# EasyEDA Pro project MACRO12-RevC.epro

# Schematic MACRO12

## Sheets
1 MACRO12_1
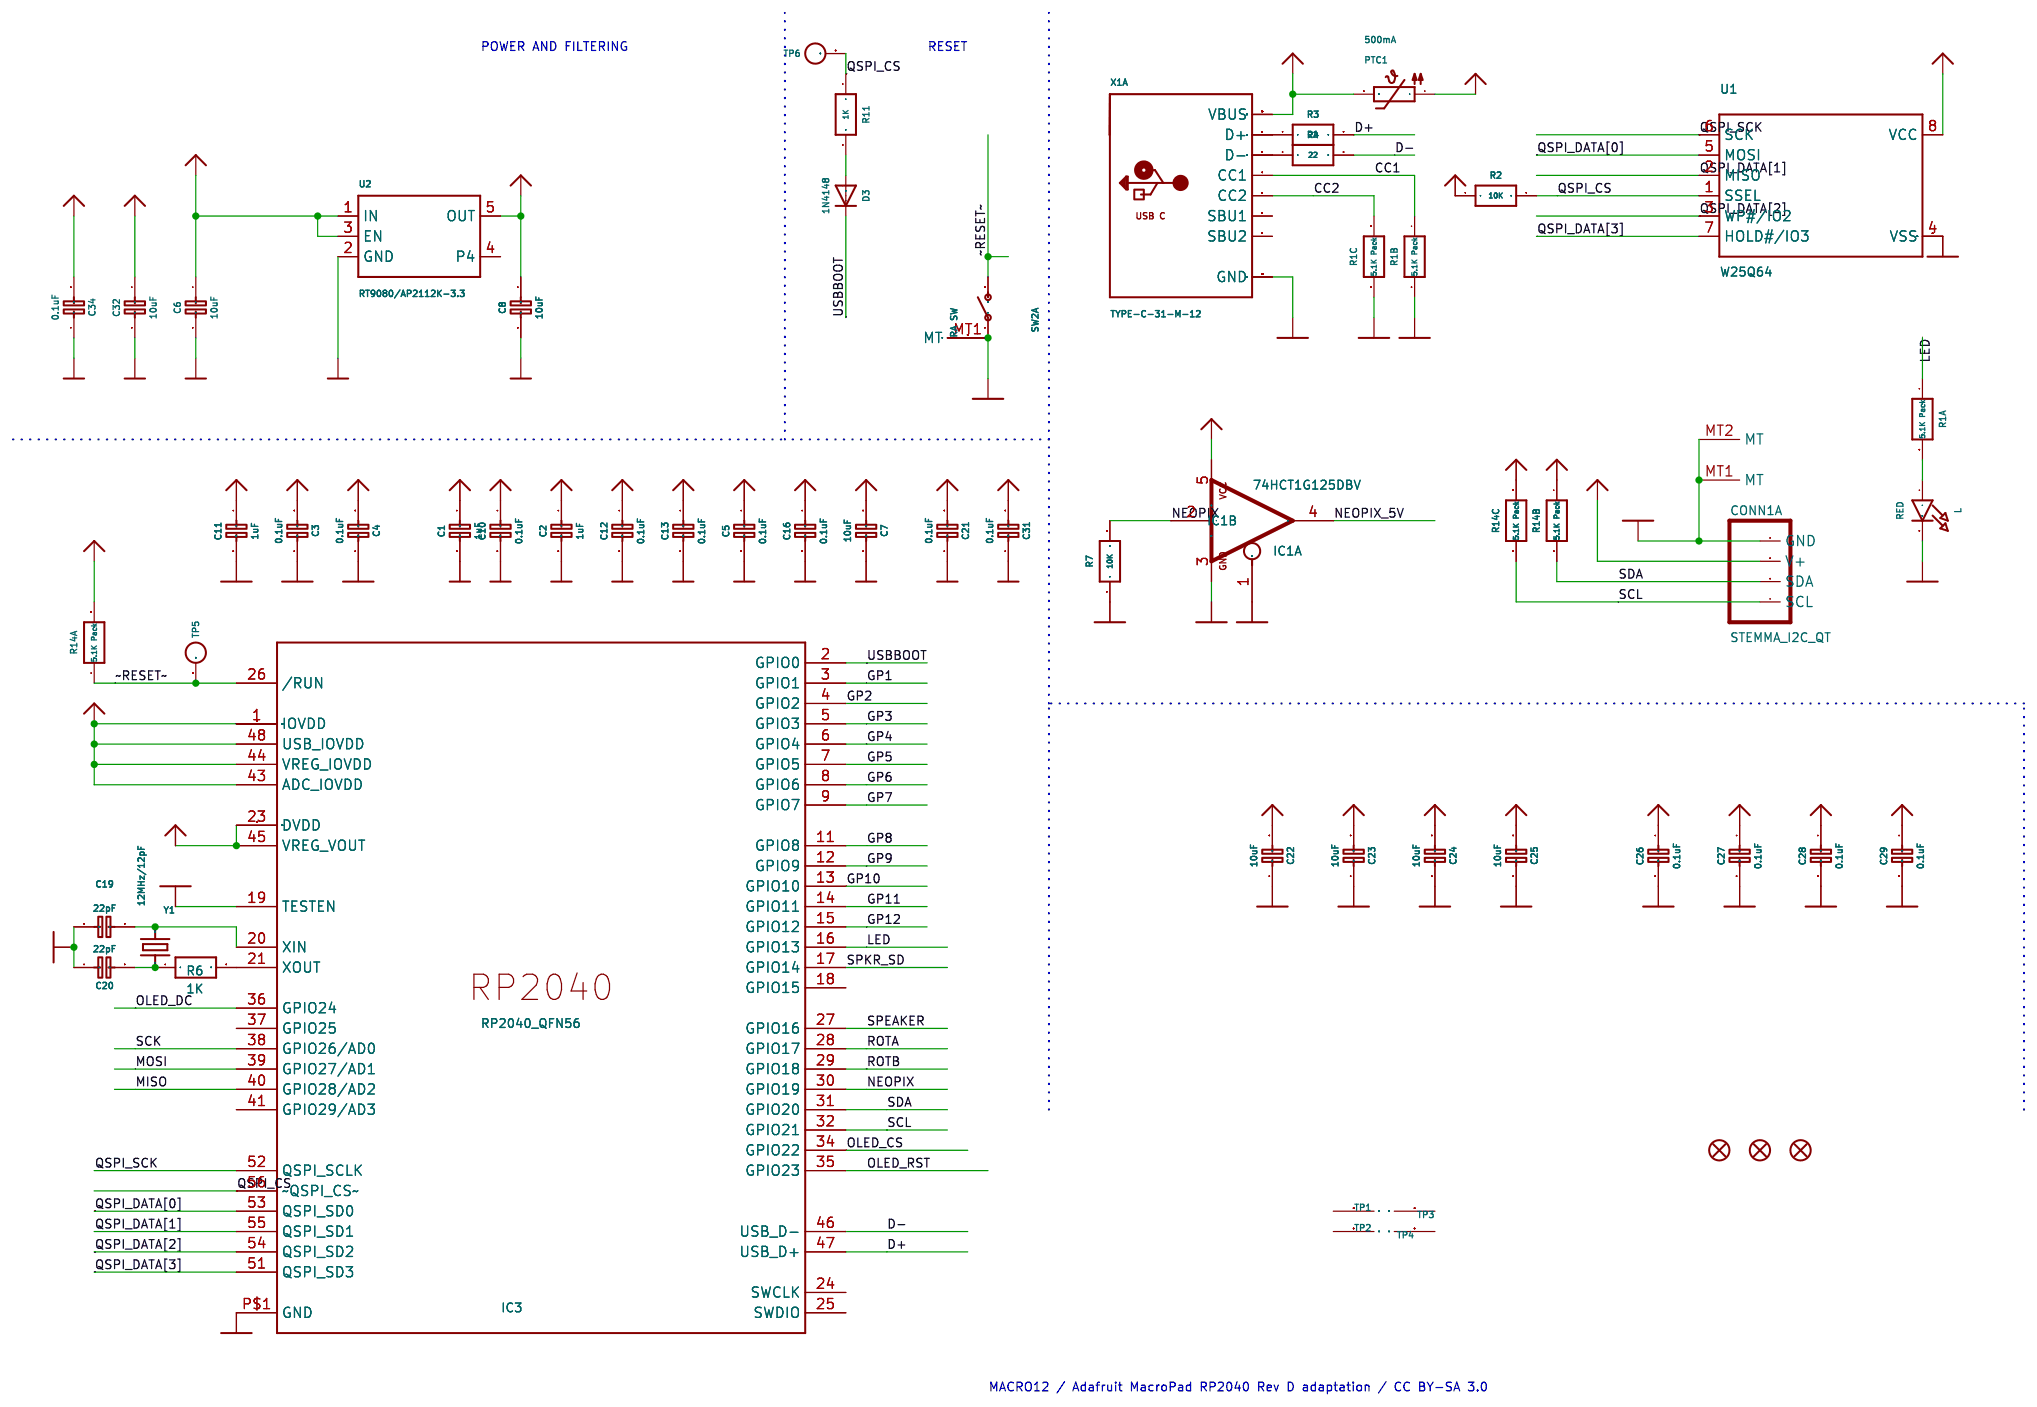
[diagram p0: MACRO12_1]
2 MACRO12_2
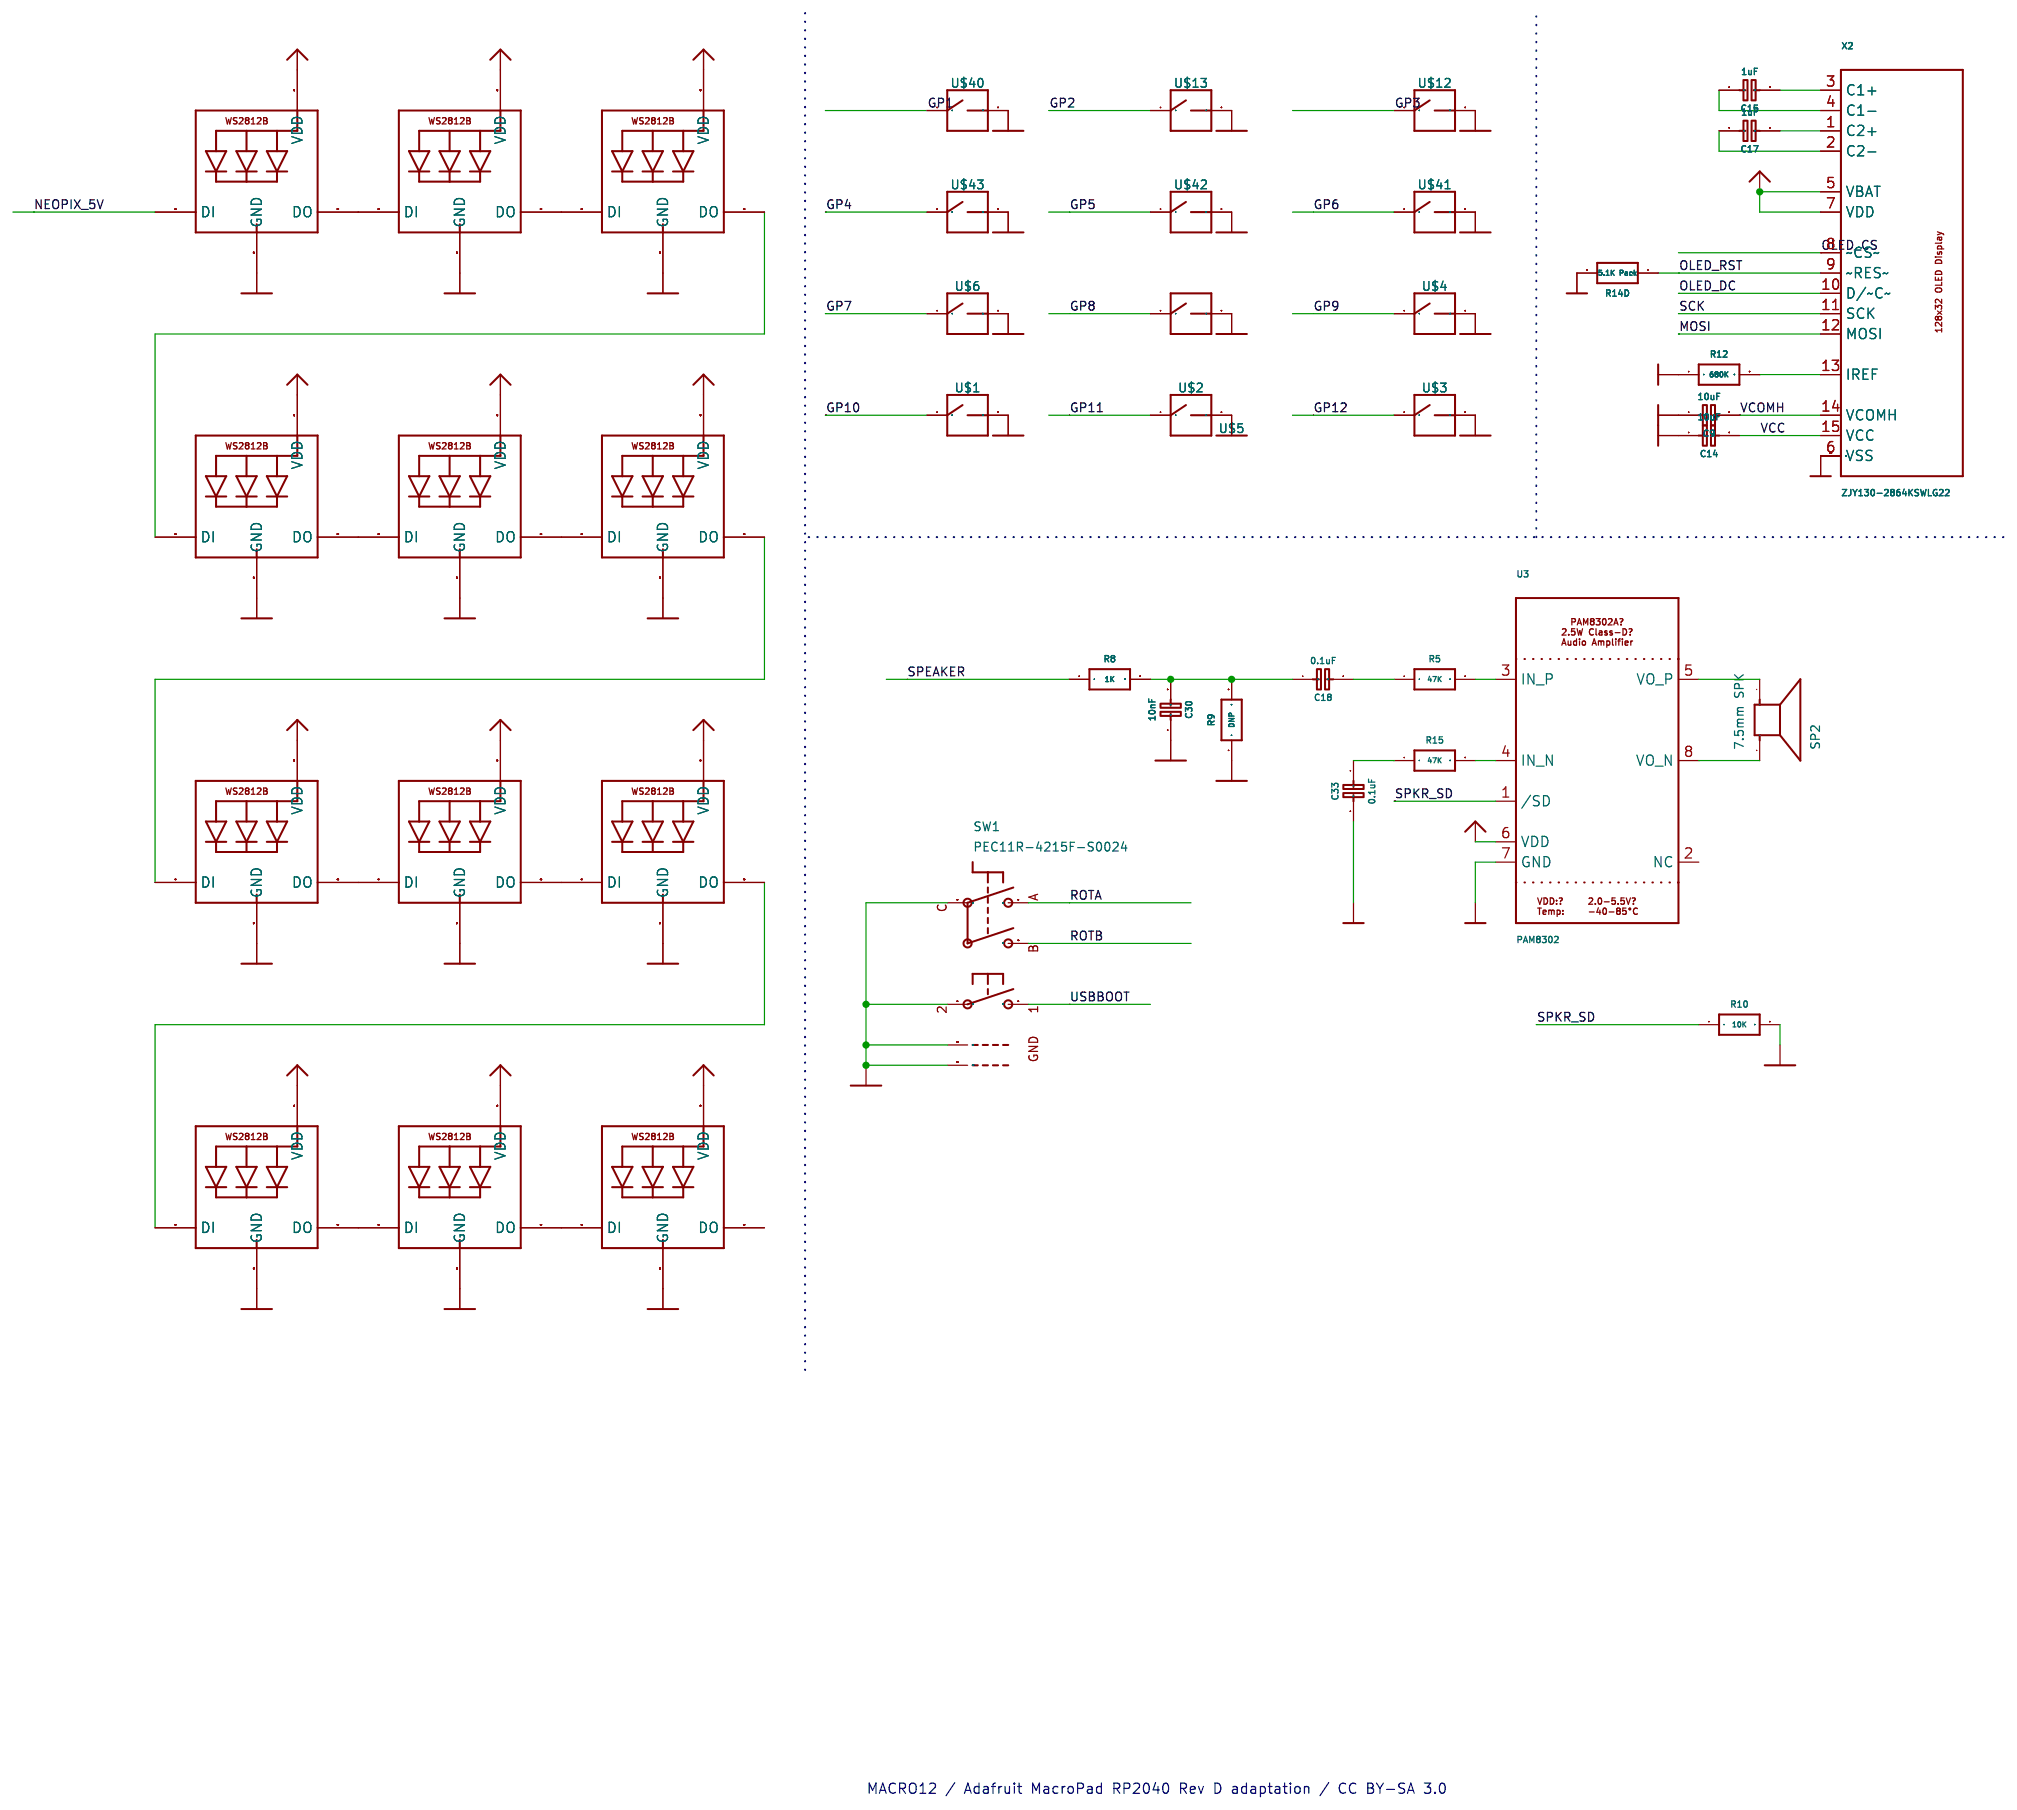
[diagram p1: MACRO12_2]

## Parts
sheet MACRO12_1
C1  1uF  [0603-NO]
C2  1uF  [0603-NO]
C3  0.1uF  [0603-NO]
C4  0.1uF  [0603-NO]
C5  0.1uF  [0603-NO]
C6  10uF  [0805-NO]
C7  10uF  [0805-NO]
C8  10uF  [0805-NO]
C10  0.1uF  [0603-NO]
C11  1uF  [0603-NO]
C12  0.1uF  [0603-NO]
C13  0.1uF  [0603-NO]
C16  0.1uF  [0603-NO]
C19  22pF  [0603-NO]
C20  22pF  [0603-NO]
C21  0.1uF  [0603-NO]
C22  10uF  [0805-NO]
C23  10uF  [0805-NO]
C24  10uF  [0805-NO]
C25  10uF  [0805-NO]
C26  0.1uF  [0603-NO]
C27  0.1uF  [0603-NO]
C28  0.1uF  [0603-NO]
C29  0.1uF  [0603-NO]
C31  0.1uF  [0603-NO]
C32  10uF  [0805-NO]
C34  0.1uF  [0603-NO]
CONN1  STEMMA_I2C_QT  [JST_SH4]  (sections G$1,G$2,G$3)
D3  1N4148  [SOD-323]
IC1  74HCT1G125DBV  [SOT23-5]  (sections A,P)
IC3  RP2040_QFN56  [QFN56_7MM_REDUCEDEPAD]
L  RED  [CHIPLED_0603_NOOUTLINE]
PTC1  500mA  [0805-NO]
R1  5.1K Pack  [RESPACK_4X0603]  (sections G$1,G$2,G$3)
R2  10K  [0603-NO]
R3  22  [0603-NO]
R4  22  [0603-NO]
R6  1K  [0603-NO]
R7  10K  [0603-NO]
R11  1K  [0603-NO]
R14  5.1K Pack  [RESPACK_4X0603]  (sections G$1,G$2,G$3,G$4)
SW2  RA SW  [SPST_TACTILE_RA]  (sections G$1,G$2)
TP1  SEWTAP_SMTNUTM3  [SMT_NUT_3MM]
TP2  SEWTAP_SMTNUTM3  [SMT_NUT_3MM]
TP3  SEWTAP_SMTNUTM3  [SMT_NUT_3MM]
TP4  SEWTAP_SMTNUTM3  [SMT_NUT_3MM]
TP5  TESTPOINTROUND1.5MMNO  [TESTPOINT_ROUND_1.5MM_NO]
TP6  TESTPOINTROUND1.5MMNO  [TESTPOINT_ROUND_1.5MM_NO]
U1  W25Q64  [USON8_4X4]
U2  RT9080/AP2112K-3.3  [SOT23-5_REGULATOR_MACRO12]
U$34  FIDUCIAL_1MM  [FIDUCIAL_1MM]
U$35  FIDUCIAL_1MM  [FIDUCIAL_1MM]
U$80  FIDUCIAL_1MM  [FIDUCIAL_1MM]
X1  TYPE-C-31-M-12  [HRO_TYPE_C_31_M_12]  (section G$1)
Y1  12MHz/12pF  [CRYSTAL_2.5X2]
sheet MACRO12_2
C9  10uF  [0805-NO]
C14  10uF  [0805-NO]
C15  1uF  [0603-NO]
C17  1uF  [0603-NO]
C18  0.1uF  [0603-NO]
C30  10nF  [0603-NO]
C33  0.1uF  [0603-NO]
LED1  WS2812B_SK6812E  [NEO3535_REVERSE]
LED2  WS2812B_SK6812E  [NEO3535_REVERSE]
LED3  WS2812B_SK6812E  [NEO3535_REVERSE]
LED4  WS2812B_SK6812E  [NEO3535_REVERSE]
LED5  WS2812B_SK6812E  [NEO3535_REVERSE]
LED6  WS2812B_SK6812E  [NEO3535_REVERSE]
LED7  WS2812B_SK6812E  [NEO3535_REVERSE]
LED8  WS2812B_SK6812E  [NEO3535_REVERSE]
LED9  WS2812B_SK6812E  [NEO3535_REVERSE]
LED10  WS2812B_SK6812E  [NEO3535_REVERSE]
LED11  WS2812B_SK6812E  [NEO3535_REVERSE]
LED12  WS2812B_SK6812E  [NEO3535_REVERSE]
R5  47K  [0603-NO]
R8  1K  [0603-NO]
R9  DNP  [0603-NO]
R10  10K  [0603-NO]
R12  680K  [0603-NO]
R15  47K  [0603-NO]
SP2  7.5mm SPK  [BUZZER_SMT_7.5MM]
SW1  PEC11R-4215F-S0024  [PEC11R_4215F_S0024_13P2]
U3  PAM8302  [MSOP8_0.65MM]
U$1  SOCKET  [KAILH_SOCKET]
U$2  SOCKET  [KAILH_SOCKET]
U$3  SOCKET  [KAILH_SOCKET]
U$4  SOCKET  [KAILH_SOCKET]
U$5  SOCKET  [KAILH_SOCKET]
U$6  SOCKET  [KAILH_SOCKET]
U$12  SOCKET  [KAILH_SOCKET]
U$13  SOCKET  [KAILH_SOCKET]
U$40  SOCKET  [KAILH_SOCKET]
U$41  SOCKET  [KAILH_SOCKET]
U$42  SOCKET  [KAILH_SOCKET]
U$43  SOCKET  [KAILH_SOCKET]
X2  ZJY130-2864KSWLG22  [ZJY130-2864KSWLG22]

## Library data of the parts
C1-C5 C10-C13 C15-C21 C26-C31 C33 C34 = microbuilder_CAP_CERAMIC_0603_NO
C6-C9 C14 C22-C25 C32 = microbuilder_CAP_CERAMIC_0805-NOOUTLINE
CONN1 = adafruit_electromech_STEMMA_I2C__QT
D3 = microbuilder_DIODE_SOD-323
IC1 = 74xx-little-us_74*1G125_DBV
IC3 = adafruit_micro_RP2040__QFN56
L = microbuilder_LED_0603_NOOUTLINE
PTC1 = microbuilder_PTC__0805
R1 R14 = microbuilder_RESISTOR_4PACK_
R2-R12 R15 = microbuilder_RESISTOR__0603_NOOUT
SW2 = adafruit_electromech_SWITCH_SPST_MNT__TACT_RA
TP1-TP4 = adafruit_electromech_SEWTAP__SMTNUTM3: FORCETHM: 1
TP5 TP6 = microbuilder_TESTPOINT_ROUND1.5MMNO
U1 = microbuilder_SPIFLASH_8PIN__4X4
U2 = adafruit_power_VREG_SOT23-5_
U$34 U$35 U$80 = microbuilder_FIDUCIAL__1MM: BOM: EXCLUDE
X1 = adafruit_electromech_USB_C_
Y1 = microbuilder_CRYSTAL_2.5X2.0
LED1-LED12 = microbuilder_WS2812B__SK6812E: ROT: 180
SP2 = microbuilder_SPEAKER__7.5MM
SW1 = adafruit_electromech_ENCODER_PLUS_SWITCH__EC11_DFM
U3 = microbuilder_AUDIOAMP_PAM8302A_
U$1-U$6 U$12 U$13 U$40-U$43 = adafruit_electromech_KBD_SWITCH_KAILH_SOCKET_BOX_JADE_KAILH_SOCKET: ROT: 180; XOFFSET: -.5; YOFFSET: 3.75
X2 = adafruit_display_ZJY130-2864KSWLG22_

## Nets
1.2V: C3.2 C4.2 C11.1 IC3.23(DVDD) IC3.45(VREG_VOUT) IC3.50(DVDD)
3.3V: C1.1 C2.1 C5.1 C7.2 C8.1 C10.1 C12.1 C13.1 C16.1 C21.2 C31.2 CONN1.2(V+) IC3.1(IOVDD) IC3.10(IOVDD) IC3.22(IOVDD) IC3.33(IOVDD) IC3.42(IOVDD) IC3.43(ADC_IOVDD) IC3.44(VREG_IOVDD) IC3.48(USB_IOVDD) IC3.49(IOVDD) R2.1 R14.6(2) R14.7(2) R14.8(2) U1.8(VCC) U2.5(OUT) X2.5(VBAT) X2.7(VDD)
5.0V: C6.1 C22.2 C23.2 C24.2 C25.2 C26.1 C27.1 C28.1 C29.1 C32.1 C34.2 IC1.5(VCC) LED1.1-VDD(VDD) LED2.1-VDD(VDD) LED3.1-VDD(VDD) LED4.1-VDD(VDD) LED5.1-VDD(VDD) LED6.1-VDD(VDD) LED7.1-VDD(VDD) LED8.1-VDD(VDD) LED9.1-VDD(VDD) LED10.1-VDD(VDD) LED11.1-VDD(VDD) LED12.1-VDD(VDD) PTC1.1 U2.1(IN) U2.3(EN) U3.6(VDD)
GND: C1.2 C2.2 C3.1 C4.1 C5.2 C6.2 C7.1 C8.2 C9.1 C10.2 C11.2 C12.2 C13.2 C14.1 C16.2 C19.1 C20.1 C21.1 C22.1 C23.1 C24.1 C25.1 C26.2 C27.2 C28.2 C29.2 C30.1 C31.1 C32.2 C33.2 C34.1 CONN1.1(GND) CONN1.MT1(MT) CONN1.MT2(MT) IC1.1(OE) IC1.3(GND) IC3.19(TESTEN) IC3.P$1(GND) L.C LED1.3-GND(GND) LED2.3-GND(GND) LED3.3-GND(GND) LED4.3-GND(GND) LED5.3-GND(GND) LED6.3-GND(GND) LED7.3-GND(GND) LED8.3-GND(GND) LED9.3-GND(GND) LED10.3-GND(GND) LED11.3-GND(GND) LED12.3-GND(GND) R1.2(1) R1.3(1) R7.1 R9.1 R10.2 R12.1 R14.5(2) SW1.P$2 SW1.P$C SW1.P$GND1 SW1.P$GND2 SW2.1(P) SW2.MT1(MT) SW2.MT2(MT) U1.4(VSS) U1.PAD(VSS) U2.2(GND) U3.7(GND) U$1.2 U$2.2 U$3.2 U$4.2 U$5.2 U$6.2 U$12.2 U$13.2 U$40.2 U$41.2 U$42.2 U$43.2 X1.A1B12(GND) X1.B1A12(GND) X2.6(VSS) X2.16(VSS) X2.SUPPORT1(VSS) X2.SUPPORT2(VSS)
VBUS: PTC1.2 X1.A4B9(VBUS) X1.B4A9(VBUS)
VCC: C14.2 X2.15(VCC)
CC1: R1.7(2) X1.A5(CC1)
CC2: R1.6(2) X1.B5(CC2)
D+: IC3.47(USB_D+) R3.2
D-: IC3.46(USB_D-) R4.2
GP1: IC3.3(GPIO1) U$40.1
GP2: IC3.4(GPIO2) U$13.1
GP3: IC3.5(GPIO3) U$12.1
GP4: IC3.6(GPIO4) U$43.1
GP5: IC3.7(GPIO5) U$42.1
GP6: IC3.8(GPIO6) U$41.1
GP7: IC3.9(GPIO7) U$6.1
GP8: IC3.11(GPIO8) U$5.1
GP9: IC3.12(GPIO9) U$4.1
GP10: IC3.13(GPIO10) U$1.1
GP11: IC3.14(GPIO11) U$2.1
GP12: IC3.15(GPIO12) U$3.1
IN+: R5.2 U3.3(IN_P)
IN-: R15.2 U3.4(IN_N)
LED: IC3.16(GPIO13) R1.1
MISO: IC3.40(GPIO28/AD2)
MOSI: IC3.39(GPIO27/AD1) X2.12(MOSI)
N$1: R3.1 X1.A6(D+) X1.B6(D+)
N$2: L.A R1.8(2)
N$3: R4.1 X1.A7(D-) X1.B7(D-)
N$4: D3.A R11.2
N$5: C19.2 IC3.20(XIN) Y1.3(2)
N$6: C20.2 R6.1 Y1.1
N$7: IC3.21(XOUT) R6.2
N$8: C18.2 R5.1
N$10: LED1.2-DOUT(DO) LED2.4-DIN(DI)
N$11: LED2.2-DOUT(DO) LED3.4-DIN(DI)
N$12: LED4.2-DOUT(DO) LED5.4-DIN(DI)
N$13: LED5.2-DOUT(DO) LED6.4-DIN(DI)
N$14: LED7.2-DOUT(DO) LED8.4-DIN(DI)
N$15: LED8.2-DOUT(DO) LED9.4-DIN(DI)
N$16: LED10.2-DOUT(DO) LED11.4-DIN(DI)
N$17: LED11.2-DOUT(DO) LED12.4-DIN(DI)
N$18: LED3.2-DOUT(DO) LED4.4-DIN(DI)
N$19: LED6.2-DOUT(DO) LED7.4-DIN(DI)
N$20: LED9.2-DOUT(DO) LED10.4-DIN(DI)
N$21: R12.2 X2.13(IREF)
N$22: SP2.- U3.5(VO_P)
N$23: C17.1 X2.2(C2-)
N$24: C17.2 X2.1(C2+)
N$25: C15.1 X2.4(C1-)
N$26: C15.2 X2.3(C1+)
N$27: SP2.+ U3.8(VO_N)
N$30: C33.1 R15.1
N$100: C18.1 C30.2 R8.2 R9.2
NEOPIX: IC1.2(I) IC3.30(GPIO19) R7.2
NEOPIX_5V: IC1.4(O) LED1.4-DIN(DI)
OLED_CS: IC3.34(GPIO22) X2.8(~CS~)
OLED_DC: IC3.36(GPIO24) X2.10(D/~C~)
OLED_RST: IC3.35(GPIO23) R14.4(1) X2.9(~RES~)
QSPI_CS: IC3.56(~QSPI_CS~) R2.2 R11.1 TP6.P$1 U1.1(SSEL)
QSPI_DATA[0]: IC3.53(QSPI_SD0) U1.5(MOSI)
QSPI_DATA[1]: IC3.55(QSPI_SD1) U1.2(MISO)
QSPI_DATA[2]: IC3.54(QSPI_SD2) U1.3(WP#/IO2)
QSPI_DATA[3]: IC3.51(QSPI_SD3) U1.7(HOLD#/IO3)
QSPI_SCK: IC3.52(QSPI_SCLK) U1.6(SCK)
ROTA: IC3.28(GPIO17) SW1.P$A
ROTB: IC3.29(GPIO18) SW1.P$B
SCK: IC3.38(GPIO26/AD0) X2.11(SCK)
SCL: CONN1.4(SCL) IC3.32(GPIO21) R14.3(1)
SDA: CONN1.3(SDA) IC3.31(GPIO20) R14.2(1)
SPEAKER: IC3.27(GPIO16) R8.1
SPKR_SD: IC3.17(GPIO14) R10.1 U3.1(/SD)
USBBOOT: D3.C IC3.2(GPIO0) SW1.P$1
VCOMH: C9.2 X2.14(VCOMH)
~RESET~: IC3.26(/RUN) R14.1 SW2.2(S) TP5.P$1

Not connected (* = marked no-connect by the designer): IC3 18(GPIO15) 24(SWCLK) 25(SWDIO) 37(GPIO25) 41(GPIO29/AD3); LED12 2-DOUT(DO); TP1 P$1(SEW); TP2 P$1(SEW); TP3 P$1(SEW); TP4 P$1(SEW); U2 4(P4); U3 2(NC); X1 A8(SBU1) B8(SBU2)

## Notes on the sheets
sheet 1
- POWER AND FILTERING
- RESET
- MACRO12 / Adafruit MacroPad RP2040 Rev D adaptation / CC BY-SA 3.0
sheet 2
- MACRO12 / Adafruit MacroPad RP2040 Rev D adaptation / CC BY-SA 3.0

# Board MACRO12
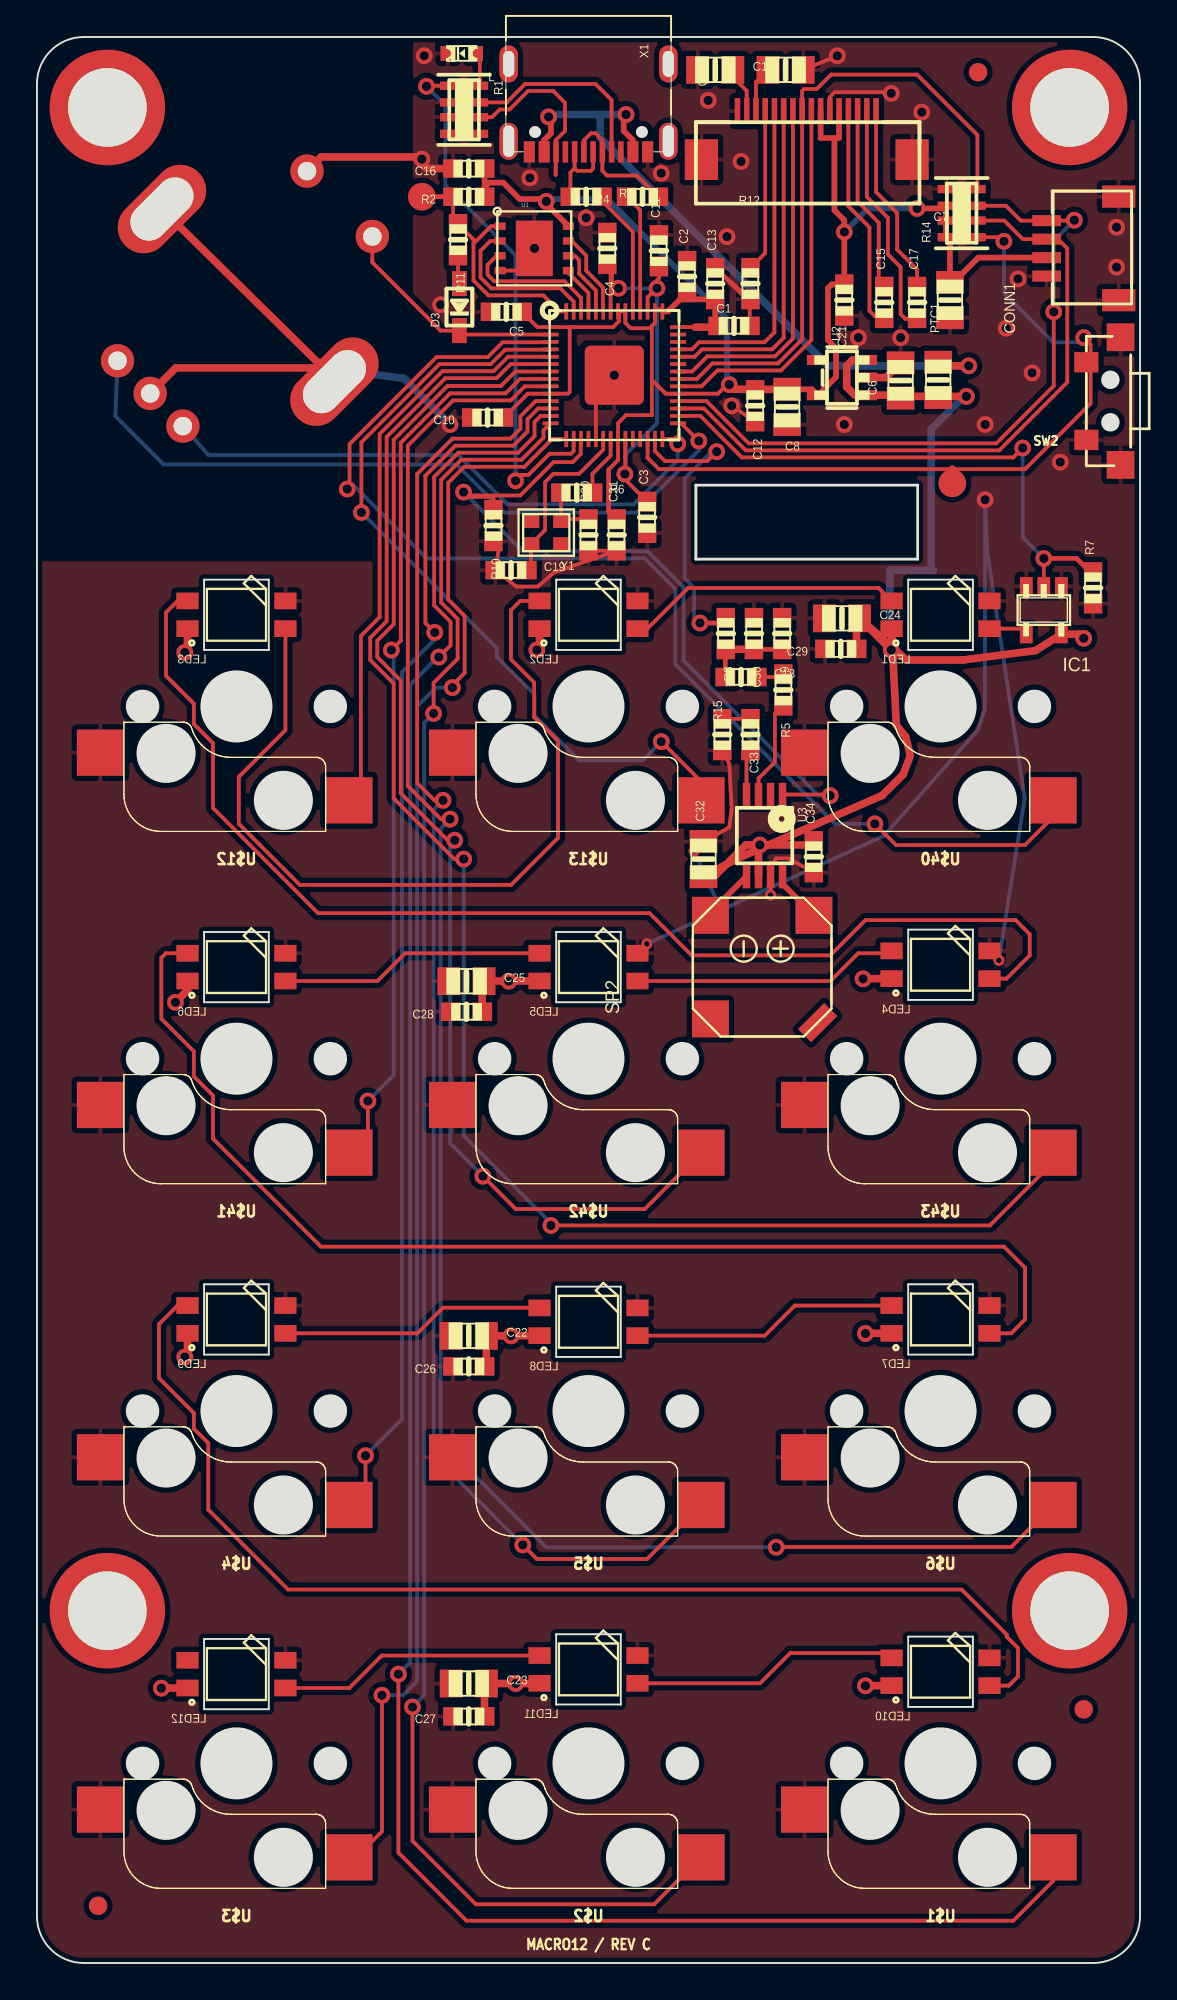
[diagram p2: board, top side]
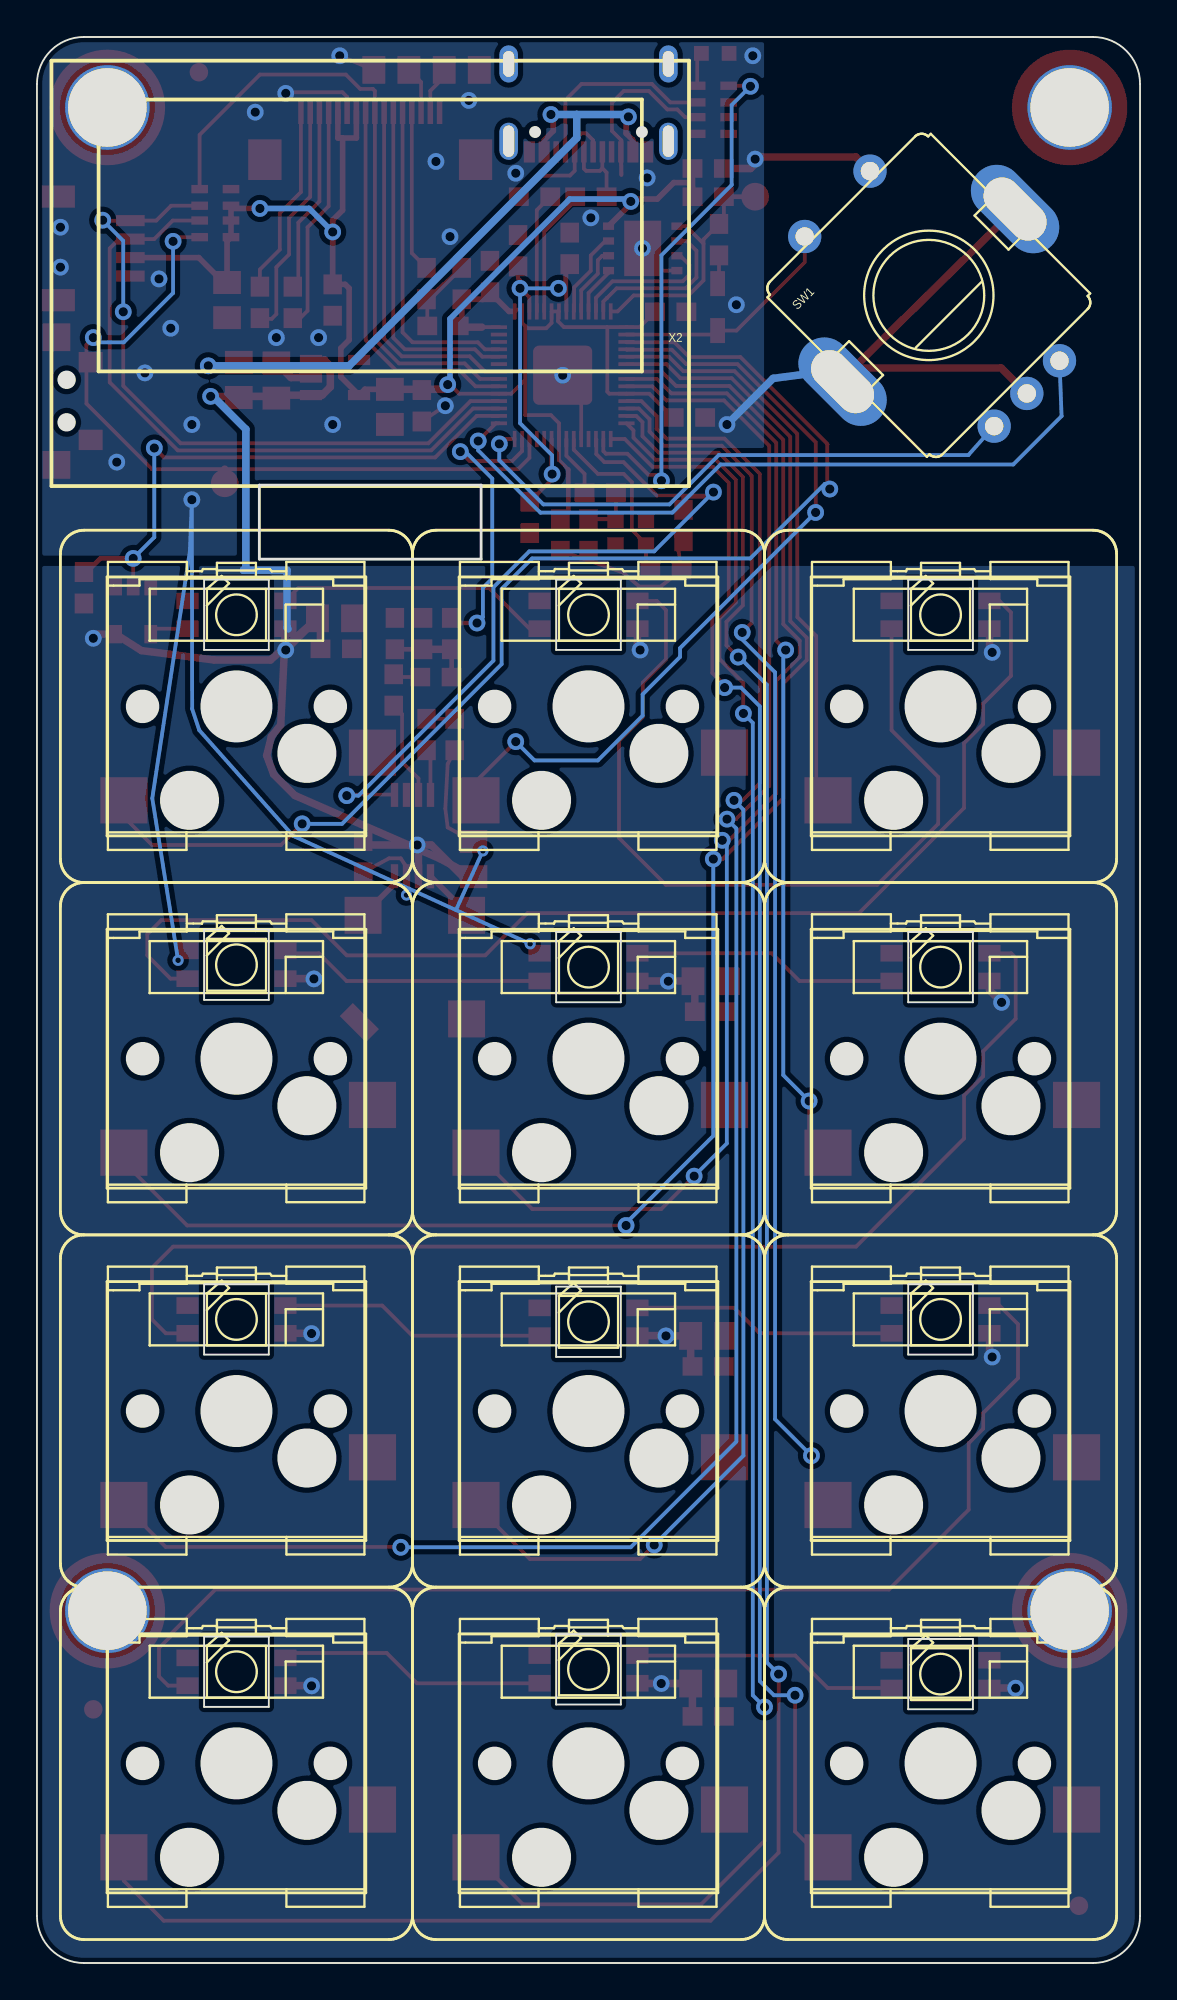
[diagram p3: board, bottom side, seen from below]

Outline 59.69 x 104.14 mm; copper layers: Top Layer, Bottom Layer. Coordinates in mm from the lower left corner of the outline.
Outline path: 0,101.6 0,2.54 arc(0.74,0.74) 2.54,0 57.15,0 arc(58.95,0.74) 59.69,2.54 59.69,101.6 arc(58.95,103.4) 57.15,104.14 2.54,104.14 arc(0.74,103.4) 0,101.6
Stack: Top Layer 0.035mm / Bottom Layer 0.035mm

## Design rules (mm)
spacing default (default): track to track 0.178, other pairs 0.152 to 0.3
spacing Plane_innerPlane: track to track 0.178, other pairs 0.152 to 0.3
spacing Copper_copperRegion: track to track 0.178, other pairs 0.152 to 0.3
track width default (default): min 0, default 0, max 2.54
track width power: min 0.203, default 0.254, max 2.54
track width 5V: min 0.406, default 0.406, max 2.54
differential pair differentialPair (default): width min 0.127, default 2.54, max 2.54; gap min 0.127, default 0.152
net GND uses Copper_copperRegion, Plane_innerPlane, default
net MISO uses Copper_copperRegion, Plane_innerPlane, default
net LED uses Copper_copperRegion, Plane_innerPlane, default
net N$2 uses Copper_copperRegion, Plane_innerPlane, default
net PB22/I6/SERCOM5.2 uses Copper_copperRegion, Plane_innerPlane, default
net PB23/I7/SERCOM5.3 uses Copper_copperRegion, Plane_innerPlane, default
net PB03/I3/AIN11/SERCOM5.1 uses Copper_copperRegion, Plane_innerPlane, default
net D+ uses Copper_copperRegion, Plane_innerPlane, default
net D- uses Copper_copperRegion, Plane_innerPlane, default
net QSPI_DATA[0] uses Copper_copperRegion, Plane_innerPlane, default
net QSPI_DATA[1] uses Copper_copperRegion, Plane_innerPlane, default
net QSPI_SCK uses Copper_copperRegion, Plane_innerPlane, default
net QSPI_CS uses Copper_copperRegion, Plane_innerPlane, default
net QSPI_DATA[2] uses Copper_copperRegion, Plane_innerPlane, default
net QSPI_DATA[3] uses Copper_copperRegion, Plane_innerPlane, default
net 1.2V uses Copper_copperRegion, Plane_innerPlane, default
net N$5 uses Copper_copperRegion, Plane_innerPlane, default
net N$6 uses Copper_copperRegion, Plane_innerPlane, default
net N$7 uses Copper_copperRegion, Plane_innerPlane, default
net USBBOOT uses Copper_copperRegion, Plane_innerPlane, default
net N$4 uses Copper_copperRegion, Plane_innerPlane, default
net N$1 uses Copper_copperRegion, Plane_innerPlane, default
net N$3 uses Copper_copperRegion, Plane_innerPlane, default
net CC2 uses Copper_copperRegion, Plane_innerPlane, default
net CC1 uses Copper_copperRegion, Plane_innerPlane, default
net GP9 uses Copper_copperRegion, Plane_innerPlane, default
net GP8 uses Copper_copperRegion, Plane_innerPlane, default
net GP1 uses Copper_copperRegion, Plane_innerPlane, default
net GP2 uses Copper_copperRegion, Plane_innerPlane, default
net GP3 uses Copper_copperRegion, Plane_innerPlane, default
net GP4 uses Copper_copperRegion, Plane_innerPlane, default
net GP5 uses Copper_copperRegion, Plane_innerPlane, default
net GP6 uses Copper_copperRegion, Plane_innerPlane, default
net GP7 uses Copper_copperRegion, Plane_innerPlane, default
net GP10 uses Copper_copperRegion, Plane_innerPlane, default
net GP11 uses Copper_copperRegion, Plane_innerPlane, default
net GP12 uses Copper_copperRegion, Plane_innerPlane, default
net ROTA uses Copper_copperRegion, Plane_innerPlane, default
net ROTB uses Copper_copperRegion, Plane_innerPlane, default
net N$10 uses Copper_copperRegion, Plane_innerPlane, default
net N$11 uses Copper_copperRegion, Plane_innerPlane, default
net N$12 uses Copper_copperRegion, Plane_innerPlane, default
net N$13 uses Copper_copperRegion, Plane_innerPlane, default
net N$14 uses Copper_copperRegion, Plane_innerPlane, default
net N$15 uses Copper_copperRegion, Plane_innerPlane, default
net N$16 uses Copper_copperRegion, Plane_innerPlane, default
net N$17 uses Copper_copperRegion, Plane_innerPlane, default
net N$18 uses Copper_copperRegion, Plane_innerPlane, default
net N$19 uses Copper_copperRegion, Plane_innerPlane, default
net N$20 uses Copper_copperRegion, Plane_innerPlane, default
net NEOPIX_5V uses Copper_copperRegion, Plane_innerPlane, default
net NEOPIX uses Copper_copperRegion, Plane_innerPlane, default
net SDA uses Copper_copperRegion, Plane_innerPlane, default
net SCL uses Copper_copperRegion, Plane_innerPlane, default
net N$21 uses Copper_copperRegion, Plane_innerPlane, default
net VCOMH uses Copper_copperRegion, Plane_innerPlane, default
net SPEAKER uses Copper_copperRegion, Plane_innerPlane, default
net VCC uses Copper_copperRegion, Plane_innerPlane, default
net OLED_CS uses Copper_copperRegion, Plane_innerPlane, default
net OLED_RST uses Copper_copperRegion, Plane_innerPlane, default
net OLED_DC uses Copper_copperRegion, Plane_innerPlane, default
net SCK uses Copper_copperRegion, Plane_innerPlane, default
net MOSI uses Copper_copperRegion, Plane_innerPlane, default
net N$23 uses Copper_copperRegion, Plane_innerPlane, default
net N$24 uses Copper_copperRegion, Plane_innerPlane, default
net N$25 uses Copper_copperRegion, Plane_innerPlane, default
net N$26 uses Copper_copperRegion, Plane_innerPlane, default
net N$8 uses Copper_copperRegion, Plane_innerPlane, default
net SPKR_SD uses Copper_copperRegion, Plane_innerPlane, default
net N$100 uses Copper_copperRegion, Plane_innerPlane, default
net IN- uses Copper_copperRegion, Plane_innerPlane, default
net IN+ uses Copper_copperRegion, Plane_innerPlane, default
net N$30 uses Copper_copperRegion, Plane_innerPlane, default
net N$22 uses Copper_copperRegion, Plane_innerPlane, default
net N$27 uses Copper_copperRegion, Plane_innerPlane, default
net VBUS uses Copper_copperRegion, Plane_innerPlane, default
net 3.3V uses Copper_copperRegion, Plane_innerPlane, power
net 5.0V uses 5V, Copper_copperRegion, Plane_innerPlane
pour e1 uses Copper_copperRegion
pour e187 uses Copper_copperRegion
pour e190 uses Copper_copperRegion

## Placement (name value [footprint] x y rotation side)
C1  1uF  [0603-NO]  37.72 88.52 0 top
C2  1uF  [0603-NO]  35.18 91.19 90 top
C3  0.1uF  [0603-NO]  33.02 78.17 90 top
C4  0.1uF  [0603-NO]  30.86 92.71 270 top
C5  0.1uF  [0603-NO]  25.4 89.28 180 top
C6  10uF  [0805-NO]  46.73 85.56 90 top
C7  10uF  [0805-NO]  49.4 89.92 90 top
C8  10uF  [0805-NO]  40.59 84.14 270 top
C9  10uF  [0805-NO]  40.51 102.36 180 top
C10  0.1uF  [0603-NO]  24.38 83.57 180 top
C11  1uF  [0603-NO]  33.66 92.58 90 top
C12  0.1uF  [0603-NO]  38.86 84.2 270 top
C13  0.1uF  [0603-NO]  36.7 90.81 90 top
C14  10uF  [0805-NO]  36.7 102.36 0 top
C15  1uF  [0603-NO]  45.85 89.79 90 top
C16  0.1uF  [0603-NO]  23.37 97.03 180 top
C17  1uF  [0603-NO]  47.62 89.79 90 top
C18  0.1uF  [0603-NO]  38.1 69.53 0 top
C19  22pF  [0603-NO]  25.65 75.31 0 top
C20  22pF  [0603-NO]  29.84 77.22 90 top
C21  0.1uF  [0603-NO]  43.69 89.92 90 top
C22  10uF  [0805-NO]  23.37 33.91 0 top
C23  10uF  [0805-NO]  23.37 15.11 0 top
C24  10uF  [0805-NO]  43.56 72.71 0 top
C25  10uF  [0805-NO]  23.24 53.09 0 top
C26  0.1uF  [0603-NO]  23.37 32.26 180 top
C27  0.1uF  [0603-NO]  23.37 13.34 180 top
C28  0.1uF  [0603-NO]  23.24 51.44 180 top
C29  0.1uF  [0603-NO]  43.5 71.06 180 top
C30  10nF  [0603-NO]  38.8 71.88 270 top
C31  0.1uF  [0603-NO]  31.37 77.22 90 top
C32  10uF  [0805-NO]  36.07 59.69 90 top
C33  0.1uF  [0603-NO]  37.08 66.42 270 top
C34  0.1uF  [0603-NO]  42.04 59.82 90 top
CONN1  STEMMA_I2C_QT  [JST_SH4]  56.64 92.71 90 top
D3  1N4148  [SOD-323]  22.86 89.53 90 top
IC1  74HCT1G125DBV  [SOT23-5]  54.48 73.15 180 top
IC3  RP2040_QFN56  [QFN56_7MM_REDUCEDEPAD]  31.24 85.85 0 top
L  RED  [CHIPLED_0603_NOOUTLINE]  22.99 103.25 90 top
LED1  WS2812B_SK6812E  [NEO3535_REVERSE]  48.9 72.9 180 bottom
LED2  WS2812B_SK6812E  [NEO3535_REVERSE]  29.84 72.9 180 bottom
LED3  WS2812B_SK6812E  [NEO3535_REVERSE]  10.79 72.9 180 bottom
LED4  WS2812B_SK6812E  [NEO3535_REVERSE]  48.9 53.97 180 bottom
LED5  WS2812B_SK6812E  [NEO3535_REVERSE]  29.84 53.85 180 bottom
LED6  WS2812B_SK6812E  [NEO3535_REVERSE]  10.79 53.85 180 bottom
LED7  WS2812B_SK6812E  [NEO3535_REVERSE]  48.9 34.8 180 bottom
LED8  WS2812B_SK6812E  [NEO3535_REVERSE]  29.84 34.67 180 bottom
LED9  WS2812B_SK6812E  [NEO3535_REVERSE]  10.79 34.8 180 bottom
LED10  WS2812B_SK6812E  [NEO3535_REVERSE]  48.9 15.75 180 bottom
LED11  WS2812B_SK6812E  [NEO3535_REVERSE]  29.84 15.88 180 bottom
LED12  WS2812B_SK6812E  [NEO3535_REVERSE]  10.79 15.62 180 bottom
PTC1  500mA  [0805-NO]  48.77 85.6 90 top
R1  5.1K Pack  [RESPACK_4X0603]  23.11 100.2 270 top
R2  10K  [0603-NO]  23.37 95.5 180 top
R3  22  [0603-NO]  29.72 95.5 0 top
R4  22  [0603-NO]  32.77 95.5 180 top
R5  47K  [0603-NO]  40.39 68.83 270 top
R6  1K  [0603-NO]  29.21 79.5 0 top
R7  10K  [0603-NO]  57.15 74.36 90 top
R8  1K  [0603-NO]  37.27 71.88 270 top
R9  DNP  [0603-NO]  40.32 71.88 270 top
R10  10K  [0603-NO]  24.7 77.72 270 top
R11  1K  [0603-NO]  22.78 93.18 270 top
R12  680K  [0603-NO]  38.61 90.81 90 top
R14  5.1K Pack  [RESPACK_4X0603]  50.04 94.61 90 top
R15  47K  [0603-NO]  38.61 66.42 270 top
SP2  7.5mm SPK  [BUZZER_SMT_7.5MM]  39.24 53.85 90 top
SW1  PEC11R-4215F-S0024  [PEC11R_4215F_S0024_13P2]  11.43 90.17 135 bottom
SW2  RA SW  [SPST_TACTILE_RA]  57.78 84.45 270 top
TP1  SEWTAP_SMTNUTM3  [SMT_NUT_3MM]  3.81 19.05 0 top
TP2  SEWTAP_SMTNUTM3  [SMT_NUT_3MM]  55.88 19.05 0 top
TP3  SEWTAP_SMTNUTM3  [SMT_NUT_3MM]  3.81 100.33 0 top
TP4  SEWTAP_SMTNUTM3  [SMT_NUT_3MM]  55.88 100.33 0 top
TP5  TESTPOINTROUND1.5MMNO  [TESTPOINT_ROUND_1.5MM_NO]  49.53 80.01 0 top
TP6  TESTPOINTROUND1.5MMNO  [TESTPOINT_ROUND_1.5MM_NO]  20.83 95.5 0 top
U1  W25Q64  [USON8_4X4]  26.91 92.71 0 top
U2  RT9080/AP2112K-3.3  [SOT23-5_REGULATOR_MACRO12]  43.56 85.72 90 top
U3  PAM8302  [MSOP8_0.65MM]  39.37 60.96 180 top
U$1  SOCKET  [KAILH_SOCKET]  48.9 10.79 0 bottom
U$2  SOCKET  [KAILH_SOCKET]  29.84 10.79 0 bottom
U$3  SOCKET  [KAILH_SOCKET]  10.79 10.79 0 bottom
U$4  SOCKET  [KAILH_SOCKET]  10.79 29.84 0 bottom
U$5  SOCKET  [KAILH_SOCKET]  29.84 29.84 0 bottom
U$6  SOCKET  [KAILH_SOCKET]  48.9 29.84 0 bottom
U$12  SOCKET  [KAILH_SOCKET]  10.79 67.94 0 bottom
U$13  SOCKET  [KAILH_SOCKET]  29.84 67.94 0 bottom
U$34  -  [FIDUCIAL_1MM]  50.93 102.23 0 top
U$35  -  [FIDUCIAL_1MM]  3.31 3.09 0 top
U$40  SOCKET  [KAILH_SOCKET]  48.9 67.94 0 bottom
U$41  SOCKET  [KAILH_SOCKET]  10.79 48.89 0 bottom
U$42  SOCKET  [KAILH_SOCKET]  29.84 48.89 0 bottom
U$43  SOCKET  [KAILH_SOCKET]  48.9 48.89 0 bottom
U$80  -  [FIDUCIAL_1MM]  56.64 13.72 0 top
X1  TYPE-C-31-M-12  [HRO_TYPE_C_31_M_12]  29.84 100.2 180 top
X2  -  [ZJY130-2864KSWLG22]  41.66 99 0 bottom
Y1  12MHz/12pF  [CRYSTAL_2.5X2]  27.56 77.34 180 top

## Footprints (pads in the part's own frame, mm; a bottom-side part is the same pattern mirrored in y, then rotated)
0603-NO
  rect 1.075x1 smd: 1(-0.85,0) 2(0.85,0)
0805-NO
  rect 1.24x1.5 smd: 1(-0.95,0) 2(0.95,0)
BUZZER_SMT_7.5MM
  rect 2x2 smd: +(2.8,-2.8) -(2.8,2.8) MT2(-2.8,2.8)
  rect 2x1 smd rot 135: MT(-3,-3)
CHIPLED_0603_NOOUTLINE
  rect 0.8x0.8 smd: A(0,-0.75) C(0,0.75)
CRYSTAL_2.5X2
  rect 0.9x0.75 smd: 1(-0.825,-0.625) 2(0.825,-0.625) 3(0.825,0.625) 4(-0.825,0.625)
FIDUCIAL_1MM
  round 1 smd: 1(0,0)
HRO_TYPE_C_31_M_12
  rect 0.6x1.15 smd: A1B12(-3.2,2.275) A4B9(-2.4,2.275) B1A12(3.2,2.275) B4A9(2.4,2.275)
  rect 0.3x1.15 smd: A5(-1.25,2.275) A6(-0.25,2.275) A7(0.25,2.275) A8(1.25,2.275) B5(1.75,2.275) B6(0.75,2.275) B7(-0.75,2.275) B8(-1.75,2.275)
  oval 1x2 hole 0.6x1.7: M1(-4.32,1.7) M2(4.32,1.7)
  oval 1x2 hole 0.6x1.4: M3(-4.32,-2.48) M4(4.32,-2.48)
JST_SH4
  rect 0.6x1.55 smd: 1(-1.5,2.006) 2(-0.5,2.006) 3(0.5,2.006) 4(1.5,2.006)
  rect 1.2x1.8 smd: MT1(-2.8,-1.894) MT2(2.8,-1.894)
KAILH_SOCKET
  rect 2.55x2.5 smd far side: 1(6.09,5.08) 2(-7.36,2.5)
MSOP8_0.65MM
  rect 0.4x1.3 smd: 1(-0.975,-2.2) 2(-0.325,-2.2) 3(0.325,-2.2) 4(0.975,-2.2) 5(0.975,2.2) 6(0.325,2.2) 7(-0.325,2.2) 8(-0.975,2.2)
NEO3535_REVERSE
  rect 1.2x0.9 smd far side: 1-VDD(2.65,-0.75) 2-DOUT(2.65,0.75) 3-GND(-2.65,0.75) 4-DIN(-2.65,-0.75)
PEC11R_4215F_S0024_13P2
  round 1.8 hole 1: P$1(-2.5,7) P$2(2.5,7) P$A(-2.5,-7.5) P$B(2.5,-7.5) P$C(0,-7.5)
  oval 2.8x5.6 hole 2x4: P$GND1(-6.6,0) P$GND2(6.6,0)
QFN56_7MM_REDUCEDEPAD
  rect 0.875x0.2 smd: 1(-3.45,2.6) 2(-3.45,2.2) 3(-3.45,1.8) 4(-3.45,1.4) 5(-3.45,1) 6(-3.45,0.6) 7(-3.45,0.2) 8(-3.45,-0.2) 9(-3.45,-0.6) 10(-3.45,-1) 11(-3.45,-1.4) 12(-3.45,-1.8) 13(-3.45,-2.2) 14(-3.45,-2.6) 29(3.45,-2.6) 30(3.45,-2.2) 31(3.45,-1.8) 32(3.45,-1.4) 33(3.45,-1) 34(3.45,-0.6) 35(3.45,-0.2) 36(3.45,0.2) 37(3.45,0.6) 38(3.45,1) 39(3.45,1.4) 40(3.45,1.8) 41(3.45,2.2) 42(3.45,2.6)
  rect 0.2x0.875 smd: 15(-2.6,-3.45) 16(-2.2,-3.45) 17(-1.8,-3.45) 18(-1.4,-3.45) 19(-1,-3.45) 20(-0.6,-3.45) 21(-0.2,-3.45) 22(0.2,-3.45) 23(0.6,-3.45) 24(1,-3.45) 25(1.4,-3.45) 26(1.8,-3.45) 27(2.2,-3.45) 28(2.6,-3.45) 43(2.6,3.45) 44(2.2,3.45) 45(1.8,3.45) 46(1.4,3.45) 47(1,3.45) 48(0.6,3.45) 49(0.2,3.45) 50(-0.2,3.45) 51(-0.6,3.45) 52(-1,3.45) 53(-1.4,3.45) 54(-1.8,3.45) 55(-2.2,3.45) 56(-2.6,3.45)
  rrect 3.2x3.2 smd: P$1(0,0)
RESPACK_4X0603
  rect 0.45x0.9 smd: 1(-1.3,-0.85) 2(-0.4,-0.85) 3(0.4,-0.85) 4(1.3,-0.85) 5(1.3,0.85) 6(0.4,0.85) 7(-0.4,0.85) 8(-1.3,0.85)
SMT_NUT_3MM
  round 4.572 hole 4.25: P$1(0,0)
SOD-323
  rect 1.35x0.8 smd: A(1.27,0) C(-1.27,0)
SOT23-5
  rect 0.69x0.99 smd: 1(-0.95,-1.29) 2(0,-1.29) 3(0.95,-1.29) 4(0.95,1.3) 5(-0.95,1.3)
SOT23-5_REGULATOR_MACRO12
  rect 0.55x1.2 smd: 1(-0.95,-1.3) 2(0,-1.3) 3(0.95,-1.3) 4(0.95,1.3) 5(-0.95,1.3)
SPST_TACTILE_RA
  rect 1.1x1.3 smd: 1(2.1,-1) 2(-2.1,-1)
  rect 1.5x1.5 smd: MT1(3.45,0.85) MT2(-3.45,0.85)
TESTPOINT_ROUND_1.5MM_NO
  round 1.5 smd: P$1(0,0)
USON8_4X4
  rect 0.6x0.4 smd: 1(-1.85,1.2) 2(-1.85,0.4) 3(-1.85,-0.4) 4(-1.85,-1.2) 5(1.85,-1.2) 6(1.85,-0.4) 7(1.85,0.4) 8(1.85,1.2)
  rect 2x3 smd: PAD(0,0)
ZJY130-2864KSWLG22
  rect 0.3x1.4 smd far side: 1(3.75,-1.14) 2(3.25,-1.14) 3(2.75,-1.14) 4(2.25,-1.14) 5(1.75,-1.14) 6(1.25,-1.14) 7(0.75,-1.14) 8(0.25,-1.14) 9(-0.25,-1.14) 10(-0.75,-1.14) 11(-1.25,-1.14) 12(-1.75,-1.14) 13(-2.25,-1.14) 14(-2.75,-1.14) 15(-3.25,-1.14) 16(-3.75,-1.14)
  rect 1.8x2.2 smd far side: SUPPORT1(-5.7,1.488) SUPPORT2(5.7,1.488)

## Nets
As in the schematic.

Pads without a net: IC3 18 24 25 37 41; LED12 2-DOUT; R1 4 5; SP2 MT MT2; TP1 P$1; TP2 P$1; TP3 P$1; TP4 P$1; U2 4; U3 2; U$34 1; U$35 1; U$80 1; X1 A8 B8 M1 M2 M3 M4; Y1 2 4

## Via types
v1: diameter 0.906, hole 0.5, Top Layer to Bottom Layer, 88 vias
v2: diameter 0.6, hole 0.3, Top Layer to Bottom Layer, 4 vias

## Routing (per net, layer and track width the routed paths; a pad name or vN(x,y) marks a point on that pad's centre or on a via; arc(x,y) is an arc through that point)
1.2V: length 25.7
  Top Layer w0.203: v1(31.47,90.55) 31.12,90.55 31.12,91.61 C4.2 31.04,91.68 IC3.50 ; C11.1 33.66,91.1 33.55,90.99 v1(33.55,90.55) 33.53,90.55 33.04,90.06 IC3.45 ; v1(31.81,80.51) 31.84,80.51 IC3.23 31.84,80.2 C3.2
  Bottom Layer w0.203: v1(31.47,90.55) v1(33.55,90.55) 33.55,83.26 31.81,81.52 v1(31.81,80.51)
3.3V: length 106.8
  Top Layer w0.203: 31.5,89.3 31.5,88.77 31.18,88.45 28.83,88.45 ; 31.5,89.3 IC3.49 ; 31.5,89.3 IC3.48 31.84,88.68 32.13,88.39 33.15,88.39 33.27,88.52 ; C5.1 27.08,88.45 IC3.1 28.83,88.45 ; IC3.43 33.84,89.41 33.55,89.41 IC3.44 33.44,88.69 33.27,88.52 ; 33.27,85.6 33.27,88.52 ; 33.27,85.6 33.27,83.69 31.88,83.69 31.44,83.26 IC3.22 31.44,81.26 30.93,80.75 ; 33.27,85.6 34.02,84.85 IC3.33 36.85,84.85 37.34,85.34 ; 28.83,88.45 28.83,84.96 28.72,84.85 IC3.10 26.56,84.85 25.27,83.57 C10.1 ; IC3.42 35.62,88.45
  Top Layer w0.254: C31.2 30.93,78.5 30.93,80.75
  Top Layer w0.305: 27.56,95.11 27.29,95.38 26.12,95.38 25.23,96.27 24.47,96.27 24.22,96.01 R2.1 C16.1 ; 27.56,95.11 U1.8 ; 27.56,95.11 v1(27.56,95.25) ; 43.15,98.68 42.41,98.68 X2.7 ; 43.15,98.68 43.41,98.68 X2.5 ; 43.15,98.68 43.15,94.77 43.69,94.23 v1(43.69,93.6) C21.2 43.01,90.77 42.8,90.55 42.8,87.76 43.24,87.31 43.24,85.76 42.26,84.78 41.94,85.09 C8.1 ; C1.1 36.7,88.52 C13.1 35.56,89.95 C2.1 34.15,89.3 IC3.43 ; v1(47.62,94.87) 49.04,94.87 R14.6 R14.8 49.4,93.1 C7.2 ; v1(37.47,85.34) 37.34,85.34 ; CONN1.2 50.94,92.21 49.59,90.87
  Top Layer w0.406: v1(37.47,85.34) 37.72,85.09 38.82,85.09 ; 35.62,88.45 36.8,88.45 C1.1 ; 49.59,90.87 C7.2 ; C8.1 38.82,85.09 ; 38.82,85.09 38.86,85.05
  Bottom Layer w0.305: v1(37.47,85.34) 37.34,85.47 37.34,88.9 30.86,95.38 27.81,95.38 27.69,95.25 v1(27.56,95.25) ; v1(47.62,94.87) 44.96,94.87 v1(43.69,93.6)
5.0V: length 97.7
  Top Layer w0.406: v1(46.23,70.99) 46.25,71.01 LED1.1-VDD 46.5,66.94 47.01,66.31 47.26,65.29 46.88,64.27 45.74,63.13 37.86,59.7 C32.1 36.64,58.74 38.35,60.45 v1(39.12,60.45) ; 8.15,34.05 8.15,32.91 v1(8,32.77) ; C28.1 24.09,52.99 C25.2 24.2,53.1 25.54,53.1 ; v1(6.73,14.86) 6.74,14.87 8.15,14.87 ; v1(44.7,53.21) 44.72,53.22 LED4.1-VDD ; LED2.1-VDD 27.19,71.14 v1(27.05,70.99) ; PTC1.1 48.83,84.71 ; 48.83,84.71 46.83,84.71 C6.1 46.57,84.78 44.26,84.78 43.81,85.22 43.81,86.36 44.13,86.67 44.86,86.67 ; 48.83,84.71 v1(50.29,84.71) ; 25.54,53.1 v1(25.53,53.09) ; 25.54,53.1 LED5.1-VDD ; C27.1 24.22,15.01 C23.2 v1(25.91,15.11) 27.18,15.11 LED11.1-VDD ; v1(56.64,71.63) 56.42,71.85 IC1.5 54.04,70.96 50.1,70.45 47.05,70.45 C24.2 ; 39.04,58.76 39.04,60.38 v1(39.12,60.45) ; 8.15,72.15 8.15,71.01 v1(8,70.87) ; v1(39.12,60.45) 41.82,60.45 42.04,60.67 ; v1(44.83,34.04) 44.84,34.05 LED7.1-VDD ; C29.1 44.35,72.54 C24.2 ; v1(7.49,51.94) 8.15,52.59 8.15,53.1 ; C24.2 46.23,70.99 ; C26.1 24.32,32.36 C22.2 v1(25.65,33.91) 25.67,33.92 LED8.1-VDD ; v1(44.83,14.99) 44.84,15 LED10.1-VDD
  Bottom Layer w0.406: 46.1,72.14 46.16,72.19 46.16,75.31 48.51,75.31 48.51,75.31 48.39,75.44 48.39,82.93 50.16,84.71 v1(50.29,84.71)
GND: length 148.8
  Top Layer w0.203: R12.1 C13.2 38.57,89.79 C1.2 ; 51.54,54.72 v2(52.05,54.22) ; C12.2 v1(37.59,84.2) ; U1.4 26.8,91.51 26.8,92.71 v1(26.92,92.71) ; C9.1 v1(43.31,103.12) ; v2(35.56,60.13) C32.2 37.47,61.4 37.59,62.42 37.47,64.83 C33.2 ; C20.1 C31.1 27.98,75.18 27.09,74.42 25.95,74.42 C19.1 25.13,77.3 R10.2 ; IC3.19 30.24,85.85 ; v2(39.69,57.74) U3.7 39.75,59.35 40,59.73 40.64,59.73 C34.1 ; LED5.3-GND v2(33,55.11) ; X2.6 42.91,100.9 43.16,101.15 45.95,101.15 v1(46.23,101.09)
  Top Layer w0.254: 30.24,85.85 v1(31.24,85.85)
  Top Layer w0.406: C6.2 45.94,85.72 44.86,85.72 ; SW1.P$C 7.51,86.25 15.5,86.25 7.36,94.24 ; SW1.P$2 15.38,97.65 20.46,97.65 21.08,97.03 C16.2
  Bottom Layer w0.203: v2(33,55.11) 45.83,60.95 50.91,66.66 51.29,67.81 v1(51.31,79.12) 51.42,76.31 53.45,62.98 v2(52.05,54.22) ; v2(39.69,57.74) 39.54,58.08 ; v2(35.56,60.13) 37.02,56.93
  Bottom Layer w0.406: 15.5,86.25 19.86,85.68 v1(22.35,83.19)
  vias: v1(20.83,97.54) v1(20.96,103.12) v1(21.84,89.66) v1(26.67,96.52) v1(29.72,94.36) v1(33.78,96.77) v1(36.32,100.71) v1(37.34,93.34) v1(38.1,97.41) v1(43.69,83.19) v1(44.45,87.88) v1(46.74,87.88) v1(47.88,100.08) v1(51.31,83.19) v1(52.45,88.39) v1(53.09,91.06) v1(53.85,85.98) v1(55.37,81.15) v1(58.42,93.85) v1(58.42,91.69)
VBUS: length 36.7
  Top Layer w0.254: 32.25,98.56 X1.A4B9
  Top Layer w0.305: 32.25,98.56 31.75,99.06 31.75,99.82 v1(31.88,99.95) ; 27.81,99.69 27.81,98.93 27.44,98.56 X1.B4A9
  Top Layer w0.406: 27.81,99.69 v1(27.69,99.82) ; PTC1.2 48.96,86.36 v1(50.42,86.36)
  Bottom Layer w0.406: 30.48,99.95 v1(31.88,99.95) ; 30.48,99.95 27.81,99.95 v1(27.69,99.82) ; 30.48,99.95 30.48,98.68 42.8,86.36 v1(50.42,86.36)
VCC: length 2.5
  Top Layer w0.203: C14.2 37.66,101.98 38.41,101.23 X2.15
CC1: length 10.7
  Top Layer w0.203: R1.7 25.42,100.6 26.42,101.6 30.23,101.6 31.09,100.73 X1.A5
CC2: length 10.8
  Top Layer w0.203: R1.6 24.62,99.8 25.04,100.22 25.58,100.22 26.57,101.22 27.94,101.22 28.57,100.58 28.57,99.06 28.07,98.55 28.07,96.69 X1.B5
D+: length 6.9
  Top Layer w0.203: IC3.47 32.24,93.61 30.57,95.29 R3.2
D-: length 6.5
  Top Layer w0.203: R4.2 32.64,94.78 IC3.46
GP1: length 65.9
  Top Layer w0.203: v1(16.79,79.7) 16.92,79.82 16.92,82.12 21.62,86.83 24.4,86.83 25.2,87.63 27.77,87.63 IC3.3 ; U$40.1 54.99,61.97 53.47,60.45 46.48,60.45 v1(45.34,61.59)
  Bottom Layer w0.203: v1(16.79,79.7) 17.06,79.97 21.09,75.95 32.89,75.95 34.54,74.3 34.54,70.23 43.18,61.59 v1(45.34,61.59)
GP2: length 44.7
  Top Layer w0.203: v1(17.56,78.43) 17.56,82.23 21.78,86.45 24.56,86.45 25.34,87.23 27.77,87.23 IC3.4 ; U$13.1 35.94,62.36 36.07,62.23 36.07,63.75 v1(33.78,66.04)
  Bottom Layer w0.203: v1(17.56,78.43) 24.89,71.09 24.89,70.62 26.92,68.59 26.92,67.44 29.34,65.02 32.77,65.02 v1(33.78,66.04)
GP3: length 31.5
  Top Layer w0.203: U$12.1 17.53,63.51 17.53,71.75 18.54,72.77 18.54,82.67 21.94,86.07 24.71,86.07 25.49,86.85 IC3.5
GP4: length 87.1
  Top Layer w0.203: U$43.1 54.74,43.81 54.48,43.56 54.48,42.8 51.56,39.88 v1(27.81,39.88) ; IC3.6 25.63,86.45 24.87,85.69 22.1,85.69 18.92,82.52 18.92,72.55 18.03,71.66 18.03,70.45 19.3,69.18 19.3,62.97 22.58,59.69 v1(23.09,59.69)
  Bottom Layer w0.203: v1(27.81,39.88) 27.81,40 23.09,44.73 v1(23.09,59.69)
GP5: length 66.8
  Top Layer w0.203: v1(22.61,60.71) 22.22,60.71 19.69,63.25 19.69,69.34 18.41,70.61 18.41,71.5 19.3,72.39 19.3,82.36 22.22,85.27 25.11,85.27 25.89,86.05 IC3.7 ; v1(24.13,42.55) 25.91,40.77 32.89,40.77 U$42.1
  Bottom Layer w0.203: v1(22.61,60.71) 22.36,60.46 22.36,44.32 v1(24.13,42.55)
GP6: length 49.2
  Top Layer w0.203: IC3.8 26.14,85.65 25.36,84.87 22.36,84.87 19.69,82.2 19.69,71.5 v1(19.18,70.99) ; U$41.1 17.91,44.84 v1(17.91,46.61)
  Bottom Layer w0.203: v1(19.18,70.99) 19.3,70.87 19.3,48.01 v1(17.91,46.61)
GP7: length 100.8
  Top Layer w0.203: U$6.1 54.99,24.76 52.72,22.5 40.02,22.5 v1(40,22.48) ; IC3.9 26.4,85.25 25.63,84.49 22.51,84.49 20.07,82.04 20.07,63.64 21.86,61.85 v1(22.35,61.85)
  Bottom Layer w0.203: v1(40,22.48) 27.56,22.48 21.84,28.19 21.84,61.34 v1(22.35,61.85)
GP8: length 81.4
  Top Layer w0.203: v1(21.97,62.86) 21.51,62.86 20.57,63.8 20.57,80.51 22.48,82.42 25.62,82.42 26.16,82.96 26.16,83.63 26.98,84.45 IC3.11 ; v1(26.29,22.61) 27.05,21.84 33.01,21.84 U$5.1
  Bottom Layer w0.203: v1(26.29,22.61) 21.46,27.43 21.46,62.36 v1(21.97,62.86)
GP9: length 66.5
  Top Layer w0.203: v1(17.78,27.43) 17.78,25.66 U$4.1 ; v1(21.53,71.95) 21.02,72.45 21.02,80.42 22.64,82.04 25.78,82.04 26.54,82.8 26.54,83.47 27.12,84.05 IC3.12
  Bottom Layer w0.203: v1(21.53,71.95) 21.53,71.56 19.75,69.79 19.75,29.4 v1(17.78,27.43)
GP10: length 123.2
  Top Layer w0.203: v1(21.75,70.61) 22.38,71.25 22.38,72.52 21.49,73.41 21.49,80.36 22.8,81.66 26.03,81.66 26.92,82.55 26.92,83.32 27.26,83.65 IC3.13 ; 54.99,5.72 54.99,4.44 52.83,2.29 23.24,2.29 19.56,5.97 v1(19.56,15.62)
  Bottom Layer w0.203: v1(19.56,15.62) 20.19,16.26 20.19,69.12 21.69,70.61 v1(21.75,70.61)
GP11: length 100.5
  Top Layer w0.203: v1(20.32,13.84) 20.32,6.6 23.75,3.18 33.4,3.18 35.94,5.72 ; v1(21.46,67.56) 21.46,69.22 22.76,70.51 22.76,72.67 21.87,73.56 21.87,80.2 22.96,81.28 26.22,81.28 27.41,82.47 27.41,82.87 IC3.14
  Bottom Layer w0.203: v1(21.46,67.56) 20.96,67.06 20.96,14.48 v1(20.32,13.84)
GP12: length 87
  Top Layer w0.203: v1(22.48,68.96) 22.42,69.02 23.14,69.75 23.14,72.83 22.25,73.72 22.25,80.04 23.11,80.9 26.38,80.9 27.88,82.4 IC3.15 ; v1(18.67,14.48) 18.67,7.11 16.76,5.21 16.76,5.59 16.88,5.72
  Bottom Layer w0.203: v1(22.48,68.96) 21.59,68.96 20.57,67.94 20.57,15.24 19.81,14.48 v1(18.67,14.48)
IN+: length 5.4
  Top Layer w0.203: R5.2 39.93,67.53 39.93,64.94 39.04,64.05 39.04,63.16
IN-: length 2.5
  Top Layer w0.203: U3.4 38.4,65.36 R15.2
LED: length 29
  Top Layer w0.203: v1(21.08,101.47) 21.11,101.5 R1.1 ; v1(25.9,80.15) 26.22,80.46 26.6,80.46 27.74,81.61 28.9,81.61 29.04,81.75 IC3.16
  Bottom Layer w0.203: v1(25.9,80.15) 25.9,92.34 22.1,96.14 22.1,100.46 v1(21.08,101.47)
MOSI: length 17.6
  Top Layer w0.203: X2.12 39.91,88.17 39.37,87.63 35.83,87.63 35.45,87.25 IC3.39
N$1: length 4.5
  Top Layer w0.203: 29.09,97.04 28.87,96.81 R3.1 ; 29.09,97.04 X1.B6 ; 29.09,97.04 29.23,96.9 29.97,96.9 30.09,97.02 X1.A6
N$2: length 1.8
  Top Layer w0.203: L.A 23.96,103.02 R1.8
N$3: length 7.2
  Top Layer w0.203: X1.A7 29.59,98.56 29.97,98.93 30.23,98.93 30.59,98.56 X1.B7 30.59,96.9 30.85,96.65 32.47,96.65 R4.1
N$4: length 1.6
  Top Layer w0.203: D3.A 22.78,90.88 R11.2
N$5: length 10.1
  Top Layer w0.203: C19.2 26.73,75.08 Y1.3 27.5,77.48 27.5,80.07 27.94,80.52 29.34,80.52 30.64,81.82 IC3.20
N$6: length 4.4
  Top Layer w0.203: Y1.1 28.48,78.07 C20.2 28.36,78.07 R6.1
N$7: length 3.3
  Top Layer w0.203: IC3.21 31.04,81.5 30.06,80.52 R6.2
N$8: length 1.5
  Top Layer w0.203: R5.1 40.23,69.53 C18.2
N$10: length 14.9
  Top Layer w0.203: LED1.2-DOUT 45.55,74.35 35.23,74.35 33.03,72.15 LED2.4-DIN
N$11: length 46.4
  Top Layer w0.203: LED2.2-DOUT 26.15,73.65 25.65,73.15 25.65,70.48 26.9,69.23 26.9,67.37 28.19,66.08 28.19,60.83 25.65,58.29 14.22,58.29 10.92,61.59 10.92,64.14 13.44,66.66 LED3.4-DIN
N$12: length 14.4
  Top Layer w0.203: LED5.4-DIN 42.94,53.1 44.44,54.6 46.12,54.6 LED4.2-DOUT
N$13: length 14.4
  Top Layer w0.203: LED6.4-DIN 18.43,53.1 19.93,54.6 LED5.2-DOUT
N$14: length 14.4
  Top Layer w0.203: LED8.4-DIN 39.38,33.92 41.01,35.55 LED7.2-DOUT
N$15: length 14.3
  Top Layer w0.203: LED8.2-DOUT 27.18,35.43 21.97,35.43 20.59,34.05 LED9.4-DIN
N$16: length 14.5
  Top Layer w0.203: LED10.2-DOUT 45.98,16.76 40.77,16.76 39.13,15.12 LED11.4-DIN
N$17: length 14.5
  Top Layer w0.203: LED11.2-DOUT 18.66,16.62 16.9,14.87 LED12.4-DIN
N$18: length 65.5
  Top Layer w0.203: 51.54,53.22 52.46,53.22 53.72,54.48 53.72,55.63 52.96,56.39 44.83,56.39 42.93,54.48 35.43,54.48 33.15,56.77 15.21,56.77 9.53,62.45 9.53,65.95 8.49,66.99 8.49,68.09 6.98,69.6 6.98,73.03 7.61,73.65 8.15,73.65
N$19: length 64.3
  Top Layer w0.203: 8.15,54.6 6.97,54.6 6.73,54.36 6.73,51.05 8.49,49.3 8.49,47.94 9.53,46.9 9.53,44.58 15.37,38.73 52.32,38.73 53.47,37.59 53.47,34.8 52.72,34.05 51.54,34.05
N$20: length 63.4
  Top Layer w0.203: 51.54,15 52.59,15 53.09,15.49 53.09,17.03 52.48,17.64 52.48,17.75 50.04,20.19 13.59,20.19 9.27,24.51 9.27,28.11 8.49,28.89 8.49,29.74 6.6,31.62 6.6,34.54 7.61,35.55 8.15,35.55
N$21: length 8.8
  Top Layer w0.203: R12.2 39.41,92.45 X2.13
N$22: length 4.5
  Top Layer w0.305: U3.5 36.45,56.81 36.45,55.88 36.44,55.89 36.44,56.65
N$23: length 12.8
  Top Layer w0.203: C17.1 47.59,88.9 46.99,88.9 46.74,89.15 46.74,91.69 46.05,92.38 46.05,94.36 44.91,95.5 X2.2
N$24: length 10.4
  Top Layer w0.203: C17.2 47.62,91.57 46.55,92.64 46.55,94.61 45.41,95.75 X2.1
N$25: length 12.2
  Top Layer w0.203: X2.4 43.91,94.99 45.05,93.85 45.05,89.33 45.44,88.94 C15.1
N$26: length 10.1
  Top Layer w0.203: C15.2 45.55,90.94 45.55,94.1 44.41,95.25 X2.3
N$27: length 2.8
  Top Layer w0.305: U3.8 40.34,58.35 SP2.+
N$30: length 1.5
  Top Layer w0.203: R15.1 C33.1
N$100: length 4.6
  Top Layer w0.254: R9.2 C30.2 38.75,71.03 ; C18.1 37.25,70.94 37.34,71.03 R8.2
  Top Layer w0.406: R8.2 38.75,71.03
NEOPIX: length 30.7
  Top Layer w0.203: v1(53.34,81.92) 52.83,81.41 38.14,81.41 35.9,83.65 IC3.30 ; v1(54.48,75.95) IC1.2
  Top Layer w0.254: v1(54.48,75.95) 56.26,75.95 57,75.21 R7.2
  Bottom Layer w0.203: v1(53.34,81.92) 53.34,77.09 v1(54.48,75.95)
NEOPIX_5V: length 2.1
  Top Layer w0.203: 53.53,71.85 53.24,72.15 51.54,72.15
OLED_CS: length 20.6
  Top Layer w0.203: X2.8 41.91,87.76 40.26,86.11 36.82,86.11 35.96,85.25 IC3.34
OLED_DC: length 19.3
  Top Layer w0.203: X2.10 40.91,87.83 39.94,86.87 36.27,86.87 35.45,86.05 34.69,86.05
OLED_RST: length 35.2
  Top Layer w0.203: IC3.35 35.71,85.65 36.55,86.49 40.1,86.49 41.41,87.8 X2.9 41.41,101.22 41.52,101.33 42.2,101.33 42.97,102.11 47.62,102.11 50.89,98.84 50.89,95.92
QSPI_CS: length 14.3
  Top Layer w0.203: 23.62,92.96 24.57,93.91 U1.1 ; 23.62,92.96 23.62,93.19 R11.1 22.52,94.3 R2.2 ; 23.62,92.96 23.62,90.98 24.43,90.17 27.4,90.17 28.27,89.3 IC3.56
  Top Layer w0.254: 22.52,95.25 22.26,95.5 TP6.P$1
QSPI_DATA[0]: length 2.7
  Top Layer w0.203: IC3.53 29.84,90.3 28.76,91.38 U1.5
QSPI_DATA[1]: length 8.8
  Top Layer w0.203: U1.2 24.53,93.11 24,92.58 24,91.13 24.59,90.55 28.32,90.55 28.85,90.02 28.86,90.02 29.04,89.83 IC3.55
QSPI_DATA[2]: length 7.7
  Top Layer w0.203: 25.79,90.93 24.74,90.93 24.38,91.29 24.38,91.82 24.87,92.31 U1.3 ; IC3.54 29.44,90.04 28.55,90.93 25.8,90.93
QSPI_DATA[3]: length 4.7
  Top Layer w0.203: IC3.51 30.62,89.32 30.62,90.6 29.72,91.5 29.72,92.33 28.94,93.11 U1.7
QSPI_SCK: length 3.8
  Top Layer w0.203: U1.6 29.1,92.31 29.34,92.07 29.34,91.34 30.24,90.44 IC3.52
ROTA: length 31.4
  Top Layer w0.203: IC3.28 34.41,82.4 v1(34.67,82.14)
  Bottom Layer w0.203: v1(34.67,82.14) 34.67,81.25 32.29,78.87 25.46,78.87 22.8,81.53 9.29,81.53 7.89,83.1
ROTB: length 40.1
  Top Layer w0.203: v1(35.81,82.3) 34.86,83.25 IC3.29
  Bottom Layer w0.203: v1(35.81,82.3) 35.81,81.79 32.45,78.42 25.31,78.42 22.7,81.03 6.86,81.03 4.25,83.64 4.36,86.63
SCK: length 18.4
  Top Layer w0.203: X2.11 40.41,87.87 39.79,87.25 35.99,87.25 35.59,86.85 IC3.38
SCL: length 37.6
  Top Layer w0.203: v1(55.02,89.28) 55.02,85.28 51.91,82.17 38.51,82.17 36.23,84.45 IC3.32 ; v1(56.13,94.23) 56.11,94.21 CONN1.4 53.24,94.21 52.43,95.02 R14.3
  Bottom Layer w0.203: v1(56.13,94.23) 55.02,93.12 v1(55.02,89.28)
SDA: length 36.3
  Top Layer w0.203: 50.89,94.22 52.34,94.22 53.35,93.21 CONN1.3 55.25,93.21 55.75,92.71 55.75,85.47 52.07,81.79 38.35,81.79 36.09,84.05 IC3.31
SPEAKER: length 16.4
  Top Layer w0.203: IC3.27 33.44,81.75 33.98,81.21 36.27,81.21 v1(36.78,81.72)
  Top Layer w0.254: v1(35.88,72.45) 37,72.45 R8.1
  Bottom Layer w0.203: v1(36.78,81.72) 36.51,81.72 35.05,80.26 35.05,74.86 35.56,74.36 35.56,72.77 v1(35.88,72.45)
SPKR_SD: length 42.1
  Top Layer w0.203: v1(42.93,63.12) 42.87,63.18 40.37,63.18 U3.1 ; R10.1 24.7,79.18 24.61,79.28 23.34,79.28 v1(23.08,79.53) 23.27,79.35 26.15,79.35 27.95,81.15 28.99,81.15 29.42,81.59 29.42,82.38 IC3.17
  Bottom Layer w0.203: v1(42.93,63.12) 42.29,63.12 34.99,70.42 34.99,74.39 33.05,76.33 26.29,76.33 v1(23.08,79.53)
USBBOOT: length 12.8
  Top Layer w0.203: IC3.2 22.97,88.05 22.81,88.21 D3.C 21.84,88.27 18.15,91.95 SW1.P$1
VCOMH: length 2.5
  Top Layer w0.203: C9.2 38.91,101.7 X2.14
~RESET~: length 41
  Top Layer w0.203: v1(52.32,93.09) 52.1,93.31 R14.1 ; IC3.26 33.04,81.39 33.66,80.77 53.47,80.77 57.01,84.32 57.01,87.51 v1(56.64,87.88)
  Top Layer w0.406: TP5.P$1 49.53,80.77
  Bottom Layer w0.203: v1(52.32,93.09) 52.32,90.3 54.99,87.63 56.39,87.63 v1(56.64,87.88)

## Copper pours and planes (outline as drawn; the poured copper is in the pictures)
5.0V on Bottom Layer: 0,75.56 59.69,75.56 59.69,0 0,0
GND on Top Layer: 0,75.82 20.32,75.82 20.32,104.14 59.69,104.14 59.69,0 0,0
GND on Bottom Layer: 20.32,104.01 59.82,104.01 59.82,76.07 20.32,76.07

## Text on the board
Top Silkscreen Layer: MACRO12 / REV C
